# Altium schematic sheet Power_Supply.SchDoc
size A4; Date: *******; ApprovedBy: *******; CheckedBy: None; Author: *******; CompanyName: *******; DrawnBy: Name; Engineer: *******; Organization: *******; Address1: *******; Address2: *******; Address3: *******; Address4: *******; DocumentNumber: Doc Num; Revision: *******; SheetNumber: 3; SheetTotal: 7; CurrentTime: *******; CurrentDate: *******; Time: *******; DocumentFullPathAndName: *******; DocumentName: *******; ModifiedDate: *******; ImagePath: *******; ProjectName: *******; Application_BuildNumber: *******
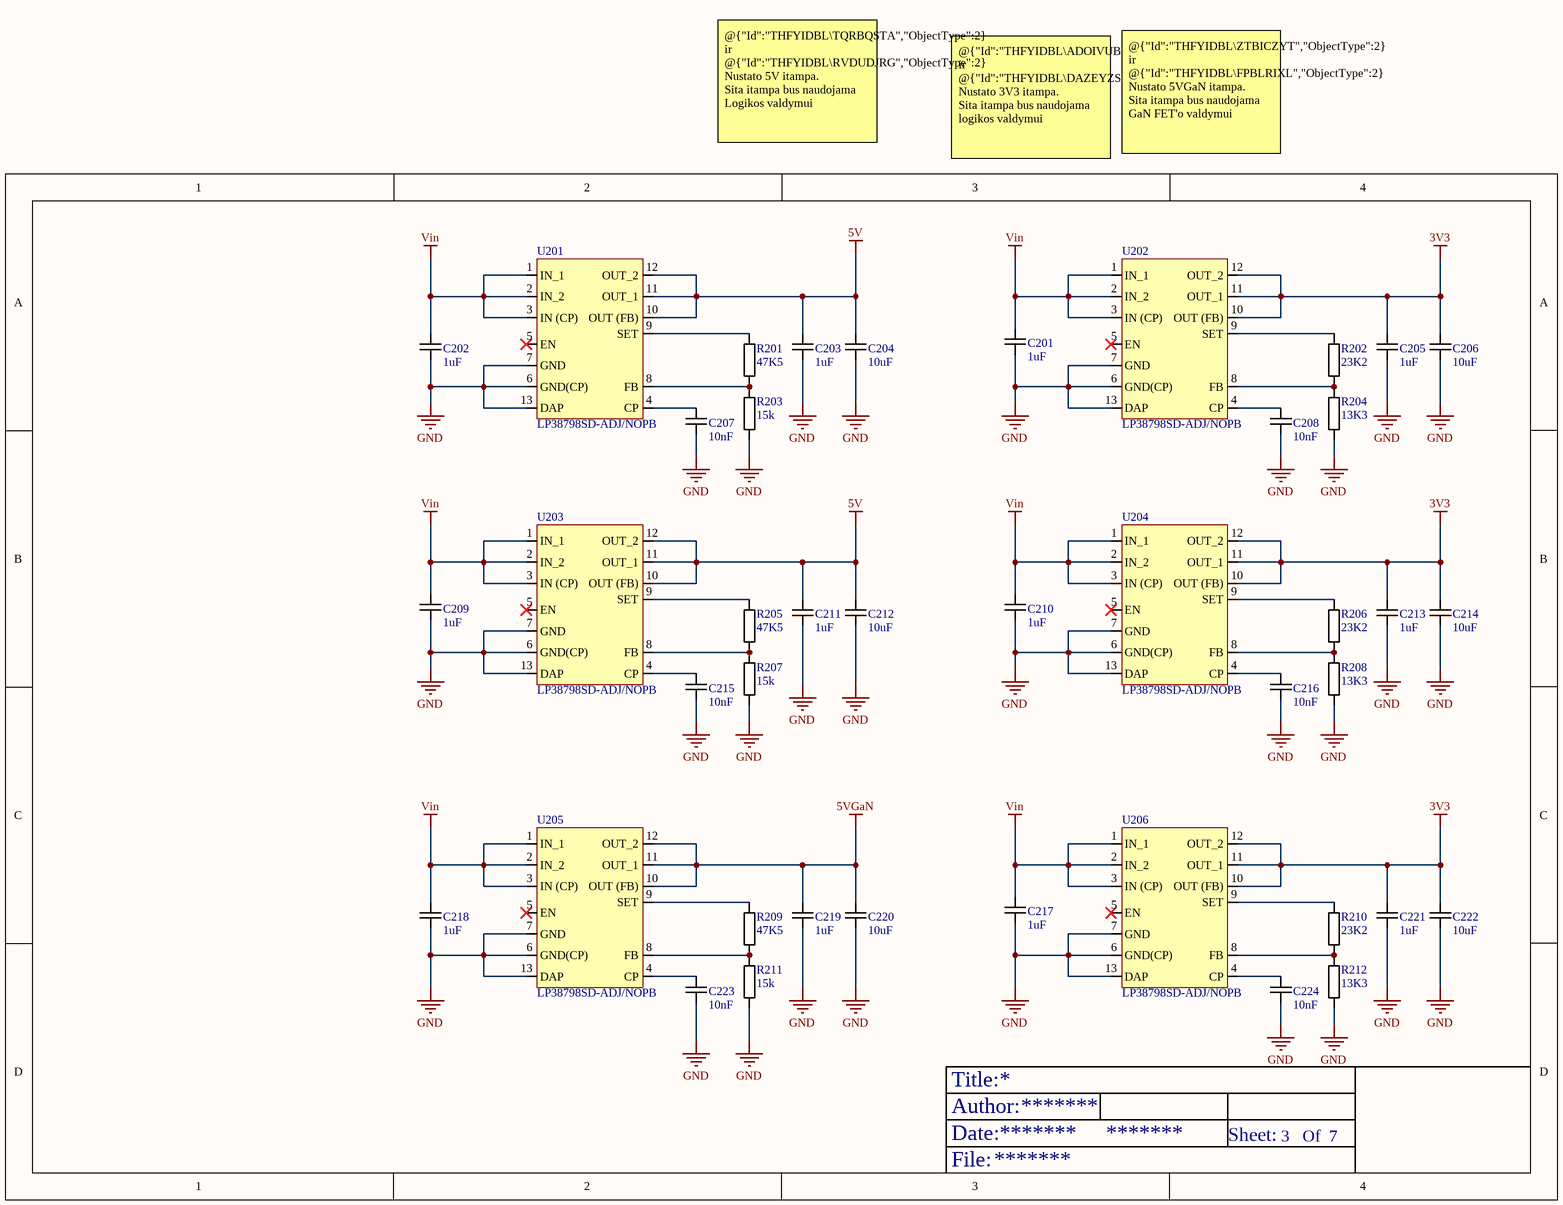
[diagram p0: Power_Supply.SchDoc]

## Parts
C201  1uF  [1uF 0603]
C202  1uF  [1uF 0603]
C203  1uF  [1uF 0603]
C204  10uF  [10uF 0805]
C205  1uF  [1uF 0603]
C206  10uF  [10uF 0805]
C207  10nF  [10nF 0402]
C208  10nF  [10nF 0402]
C209  1uF  [1uF 0603]
C210  1uF  [1uF 0603]
C211  1uF  [1uF 0603]
C212  10uF  [10uF 0805]
C213  1uF  [1uF 0603]
C214  10uF  [10uF 0805]
C215  10nF  [10nF 0402]
C216  10nF  [10nF 0402]
C217  1uF  [1uF 0603]
C218  1uF  [1uF 0603]
C219  1uF  [1uF 0603]
C220  10uF  [10uF 0805]
C221  1uF  [1uF 0603]
C222  10uF  [10uF 0805]
C223  10nF  [10nF 0402]
C224  10nF  [10nF 0402]
R201  47K5  [47.5k 0402]
R202  23K2  [23.2k 0402]
R203  15k  [15k 0402]
R204  13K3  [13k3 0402]
R205  47K5  [47.5k 0402]
R206  23K2  [23.2k 0402]
R207  15k  [15k 0402]
R208  13K3  [13k3 0402]
R209  47K5  [47.5k 0402]
R210  23K2  [23.2k 0402]
R211  15k  [15k 0402]
R212  13K3  [13k3 0402]
U201  LP38798SD-ADJ/NOPB  [LP38798SD-ADJ/NOPB]
U202  LP38798SD-ADJ/NOPB  [LP38798SD-ADJ/NOPB]
U203  LP38798SD-ADJ/NOPB  [LP38798SD-ADJ/NOPB]
U204  LP38798SD-ADJ/NOPB  [LP38798SD-ADJ/NOPB]
U205  LP38798SD-ADJ/NOPB  [LP38798SD-ADJ/NOPB]
U206  LP38798SD-ADJ/NOPB  [LP38798SD-ADJ/NOPB]

## Nets
3V3: C205.2 C206.2 C213.2 C214.2 C221.2 C222.2 U202.10(OUT_(FB)) U202.11(OUT_1) U202.12(OUT_2) U204.10(OUT_(FB)) U204.11(OUT_1) U204.12(OUT_2) U206.10(OUT_(FB)) U206.11(OUT_1) U206.12(OUT_2)
5V: C203.2 C204.2 C211.2 C212.2 U201.10(OUT_(FB)) U201.11(OUT_1) U201.12(OUT_2) U203.10(OUT_(FB)) U203.11(OUT_1) U203.12(OUT_2)
5VGaN: C219.2 C220.2 U205.10(OUT_(FB)) U205.11(OUT_1) U205.12(OUT_2)
GND: C201.1 C202.1 C203.1 C204.1 C205.1 C206.1 C207.1 C208.1 C209.1 C210.1 C211.1 C212.1 C213.1 C214.1 C215.1 C216.1 C217.1 C218.1 C219.1 C220.1 C221.1 C222.1 C223.1 C224.1 R203.1 R204.1 R207.1 R208.1 R211.1 R212.1 U201.6(GND(CP)) U201.7(GND) U201.13(DAP) U202.6(GND(CP)) U202.7(GND) U202.13(DAP) U203.6(GND(CP)) U203.7(GND) U203.13(DAP) U204.6(GND(CP)) U204.7(GND) U204.13(DAP) U205.6(GND(CP)) U205.7(GND) U205.13(DAP) U206.6(GND(CP)) U206.7(GND) U206.13(DAP)
Vin: C201.2 C202.2 C209.2 C210.2 C217.2 C218.2 U201.1(IN_1) U201.2(IN_2) U201.3(IN_(CP)) U202.1(IN_1) U202.2(IN_2) U202.3(IN_(CP)) U203.1(IN_1) U203.2(IN_2) U203.3(IN_(CP)) U204.1(IN_1) U204.2(IN_2) U204.3(IN_(CP)) U205.1(IN_1) U205.2(IN_2) U205.3(IN_(CP)) U206.1(IN_1) U206.2(IN_2) U206.3(IN_(CP))
NetC207_2: C207.2 U201.4(CP)
NetC208_2: C208.2 U202.4(CP)
NetC215_2: C215.2 U203.4(CP)
NetC216_2: C216.2 U204.4(CP)
NetC223_2: C223.2 U205.4(CP)
NetC224_2: C224.2 U206.4(CP)
NetR201_1: R201.1 R203.2 U201.8(FB)
NetR201_2: R201.2 U201.9(SET)
NetR202_1: R202.1 U202.9(SET)
NetR202_2: R202.2 R204.2 U202.8(FB)
NetR205_1: R205.1 R207.2 U203.8(FB)
NetR205_2: R205.2 U203.9(SET)
NetR206_1: R206.1 U204.9(SET)
NetR206_2: R206.2 R208.2 U204.8(FB)
NetR209_1: R209.1 R211.2 U205.8(FB)
NetR209_2: R209.2 U205.9(SET)
NetR210_1: R210.1 U206.9(SET)
NetR210_2: R210.2 R212.2 U206.8(FB)

Not connected (* = marked no-connect by the designer): U201 5(EN)*; U202 5(EN)*; U203 5(EN)*; U204 5(EN)*; U205 5(EN)*; U206 5(EN)*

## Notes on the sheet
- @{"Id":"THFYIDBL\TQRBQSTA","ObjectType":2} ir @{"Id":"THFYIDBL\RVDUDJRG","ObjectType":2} Nustato 5V itampa.
  Sita itampa bus naudojama Logikos valdymui
- @{"Id":"THFYIDBL\ZTBICZYT","ObjectType":2} ir @{"Id":"THFYIDBL\FPBLRIXL","ObjectType":2} Nustato 5VGaN itampa.
  Sita itampa bus naudojama GaN FET'o valdymui
- @{"Id":"THFYIDBL\ADOIVUBA","ObjectType":2} ir @{"Id":"THFYIDBL\DAZEYZSS","ObjectType":2} Nustato 3V3 itampa.
  Sita itampa bus naudojama logikos valdymui
- Title:
- Date:
- Author:
- Sheet:
- Of
- File:

## Library data of the parts
C201-C203 C205 C209-C211 C213 C217-C219 C221 = 1uF 0603: CGA3E1X7R1E105K080AC
C204 C206 C212 C214 C220 C222 = 10uF 0805: GRJ21BR61E106KE01K
C207 C208 C215 C216 C223 C224 = 10nF 0402: C0402C103J5RACTU
R201 R205 R209 = 47K5 0402: CR0402-FX-4752GLF
R202 R206 R210 = 23K2 0402: CR0402-FX-2322GLF
R203 R207 R211 = 15k 0402: CRCW040215K0FKED
R204 R208 R212 = 13K3 0402: CRCW040213K3FKED
U201-U206 = LP38798SD-ADJ/NOPB: input 3-20V output 1.5-5V